# EasyEDA Pro project RK3566_handy_V1.0.epro, schematic RK3566_2, sheets 21 to 23 of 25

## Sheets
21 Power_Extern: Create Date: 2026-10-03; Page Name: Power_Extern; Update Date: 2026-10-03
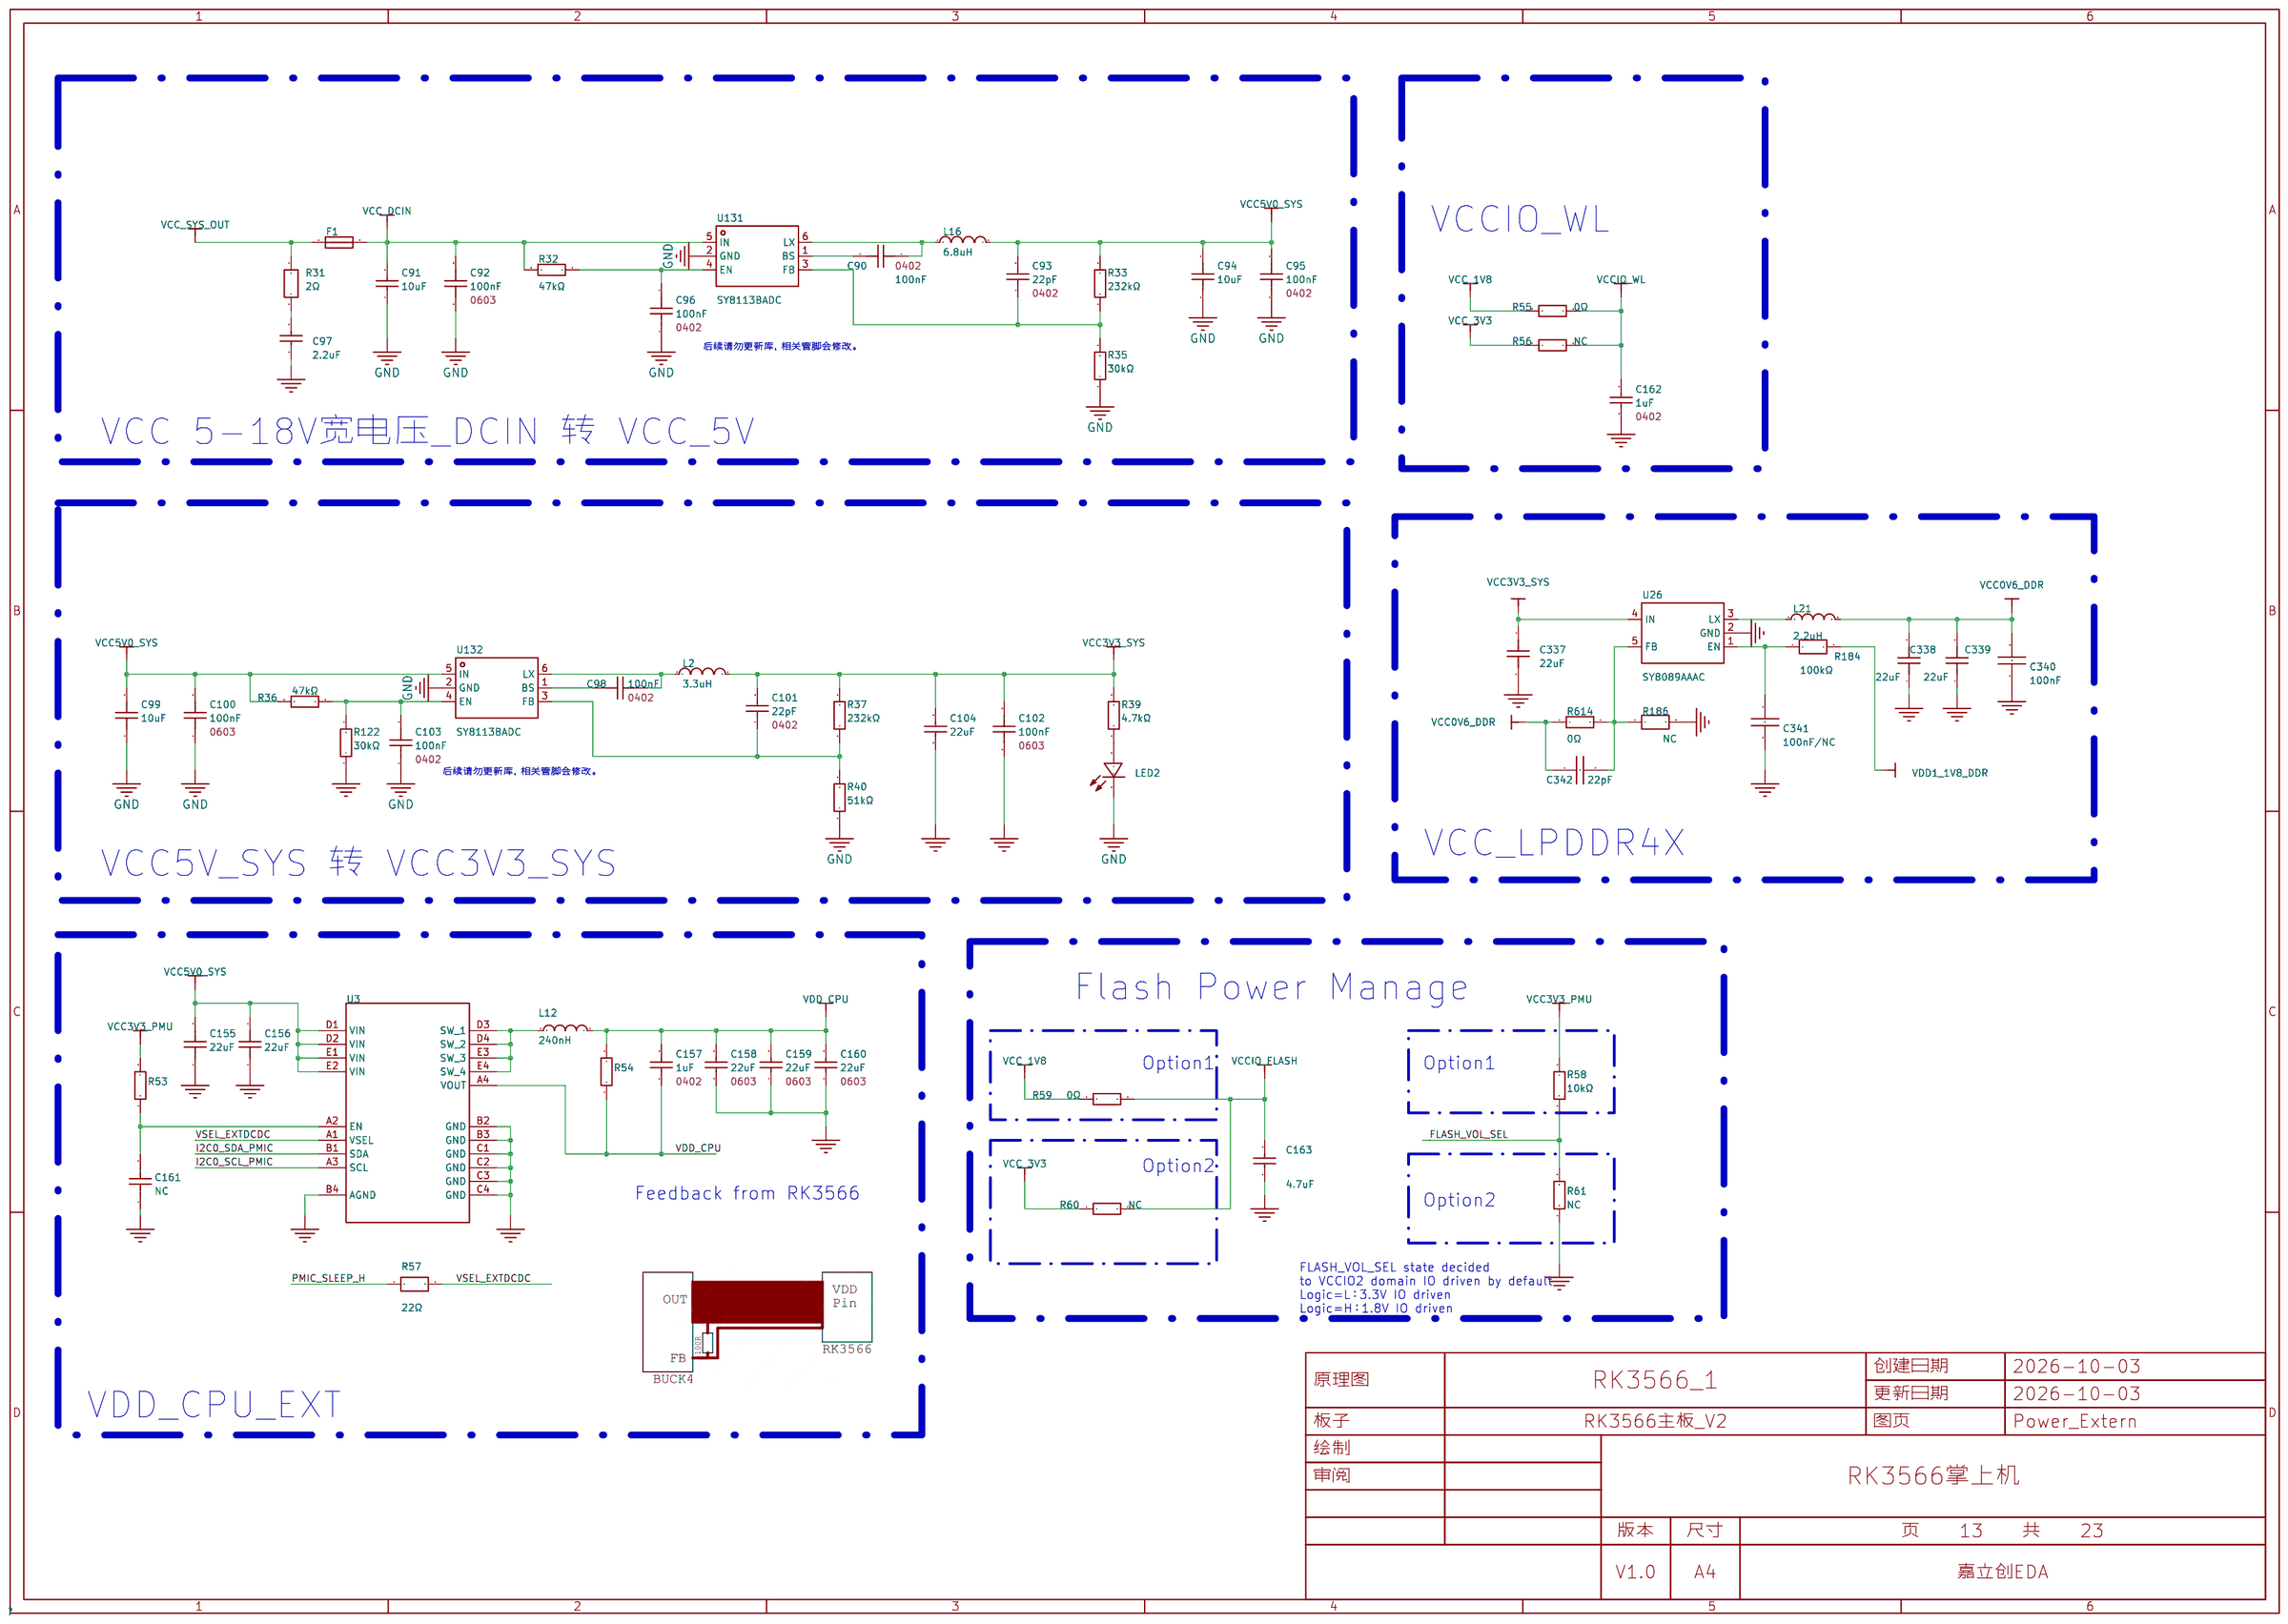
[diagram p20: Power_Extern]
22 Power_RK809-5_PMIC: Create Date: 2026-10-03; Page Name: Power_RK809-5_PMIC; Update Date: 2026-10-03
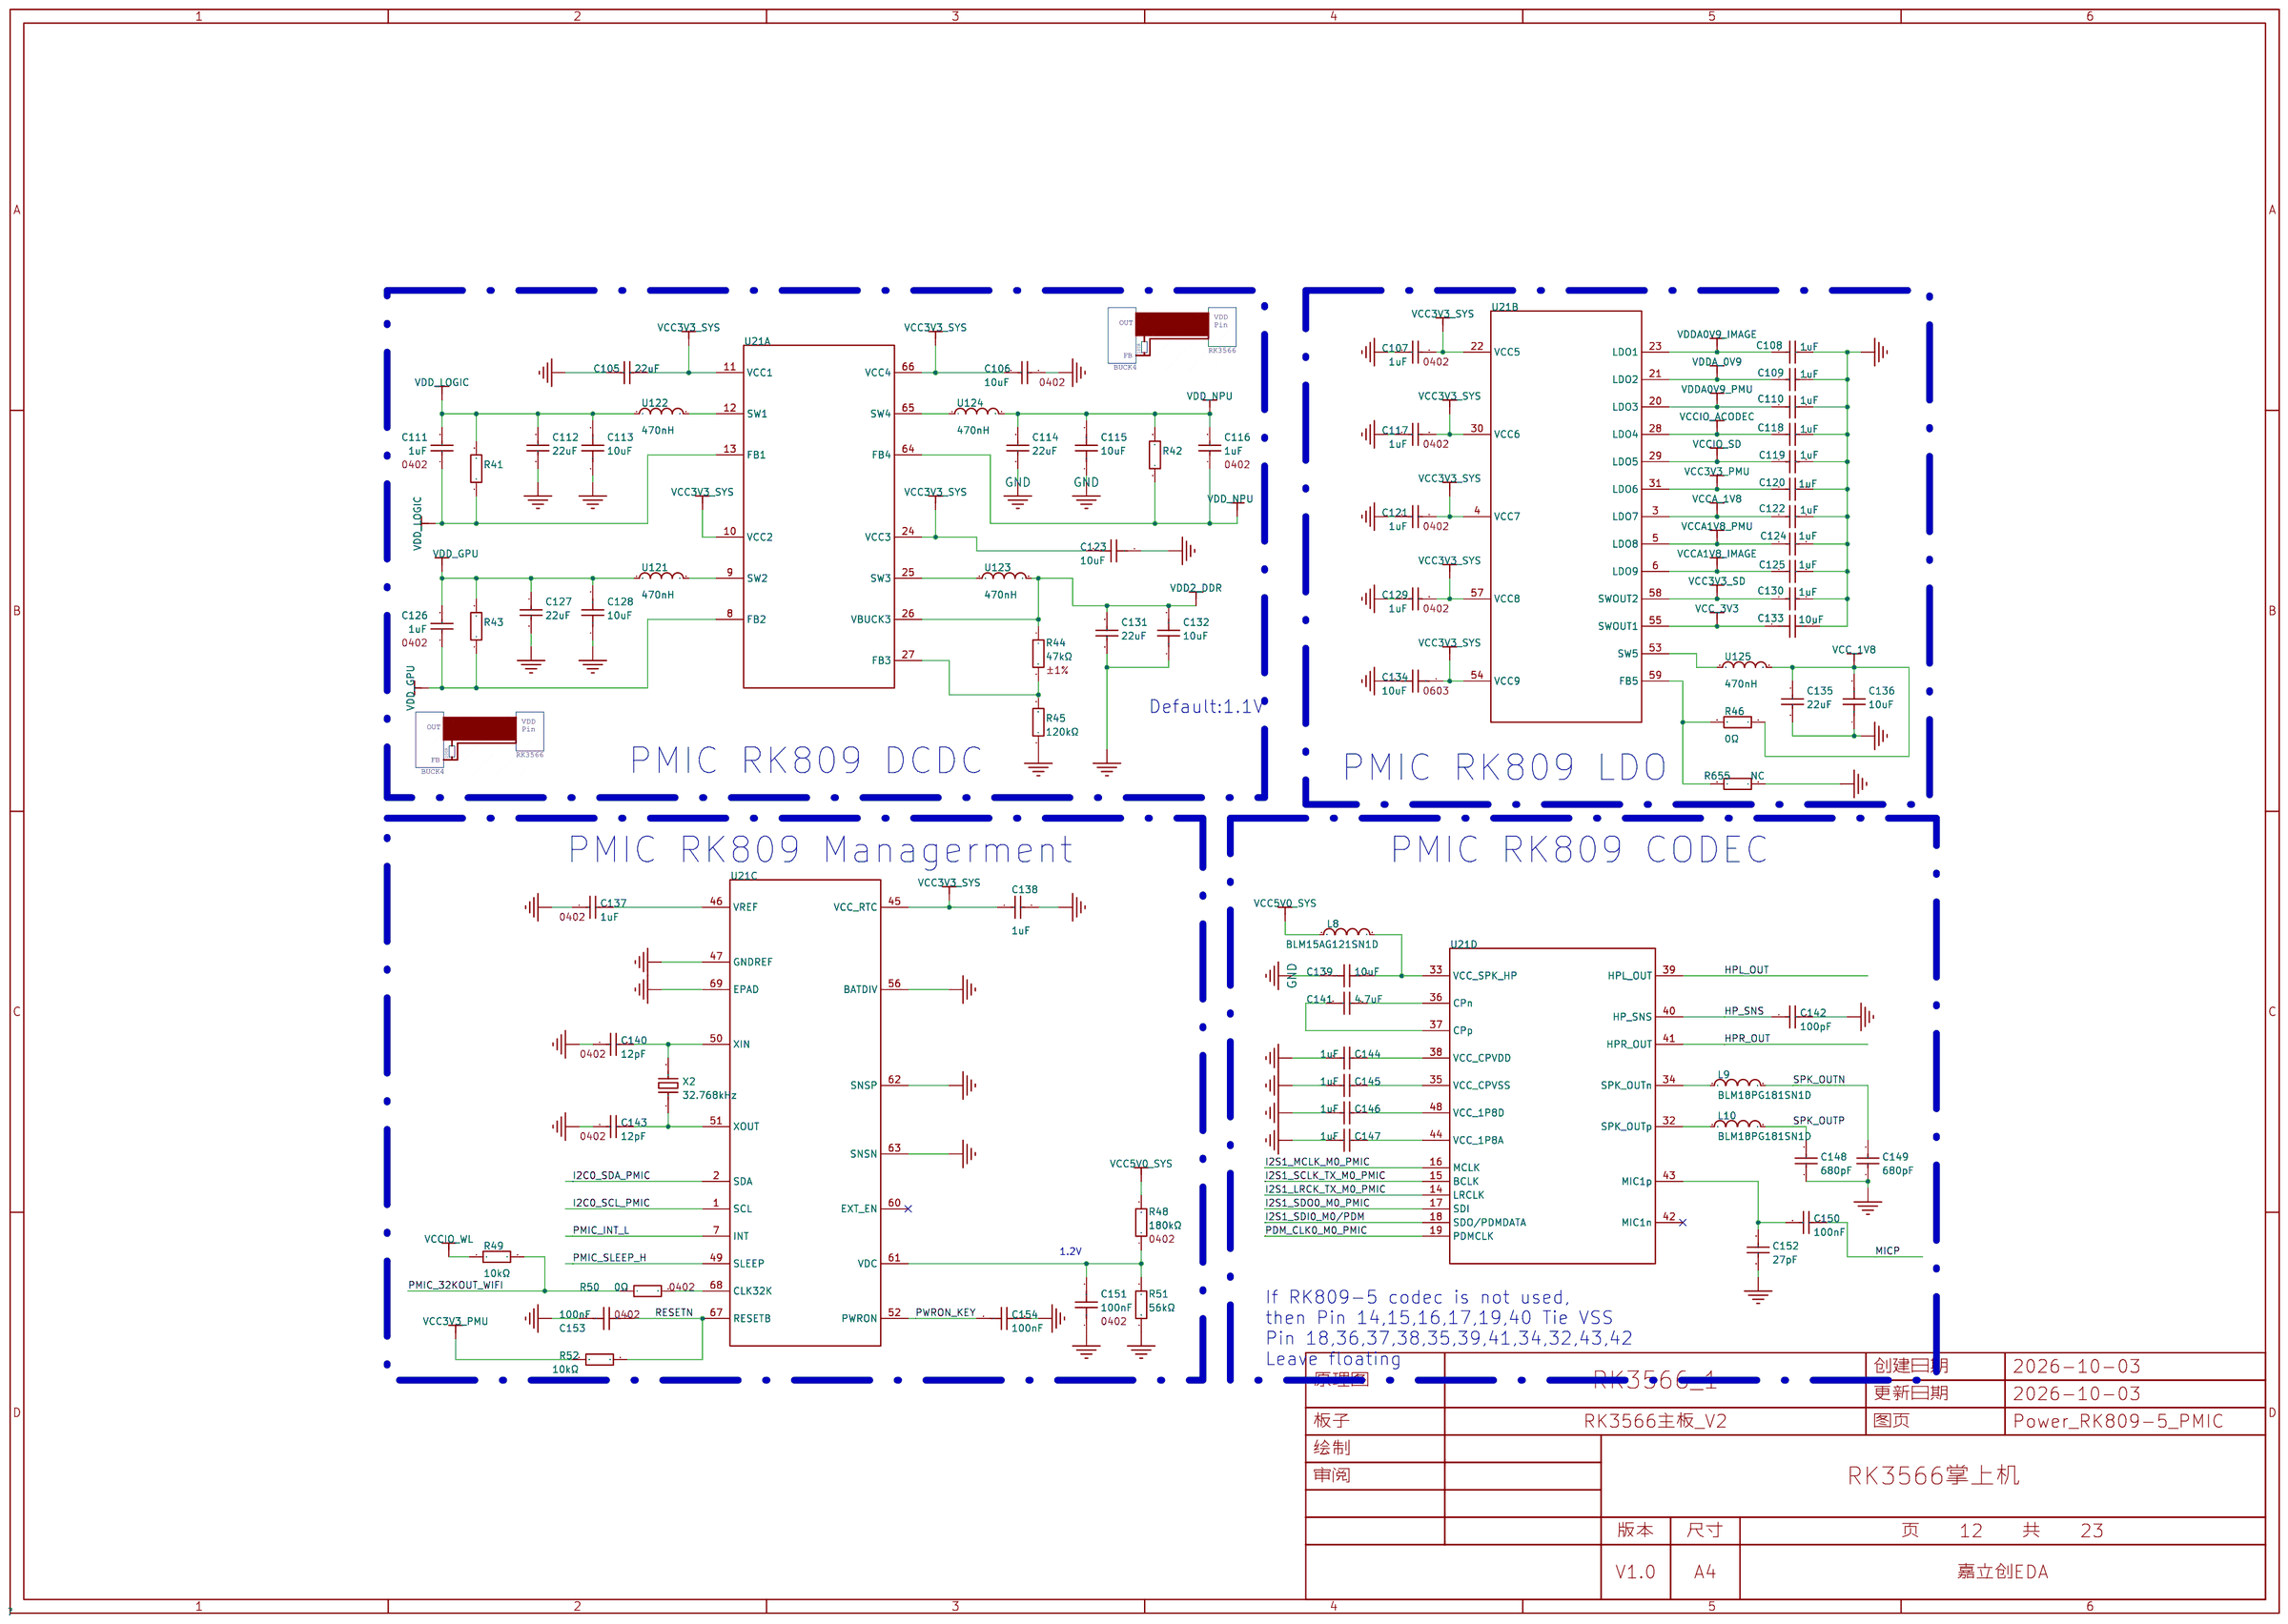
[diagram p21: Power_RK809-5_PMIC]
23 WIFI: Create Date: 2026-10-03; Page Name: WIFI; Update Date: 2026-10-03
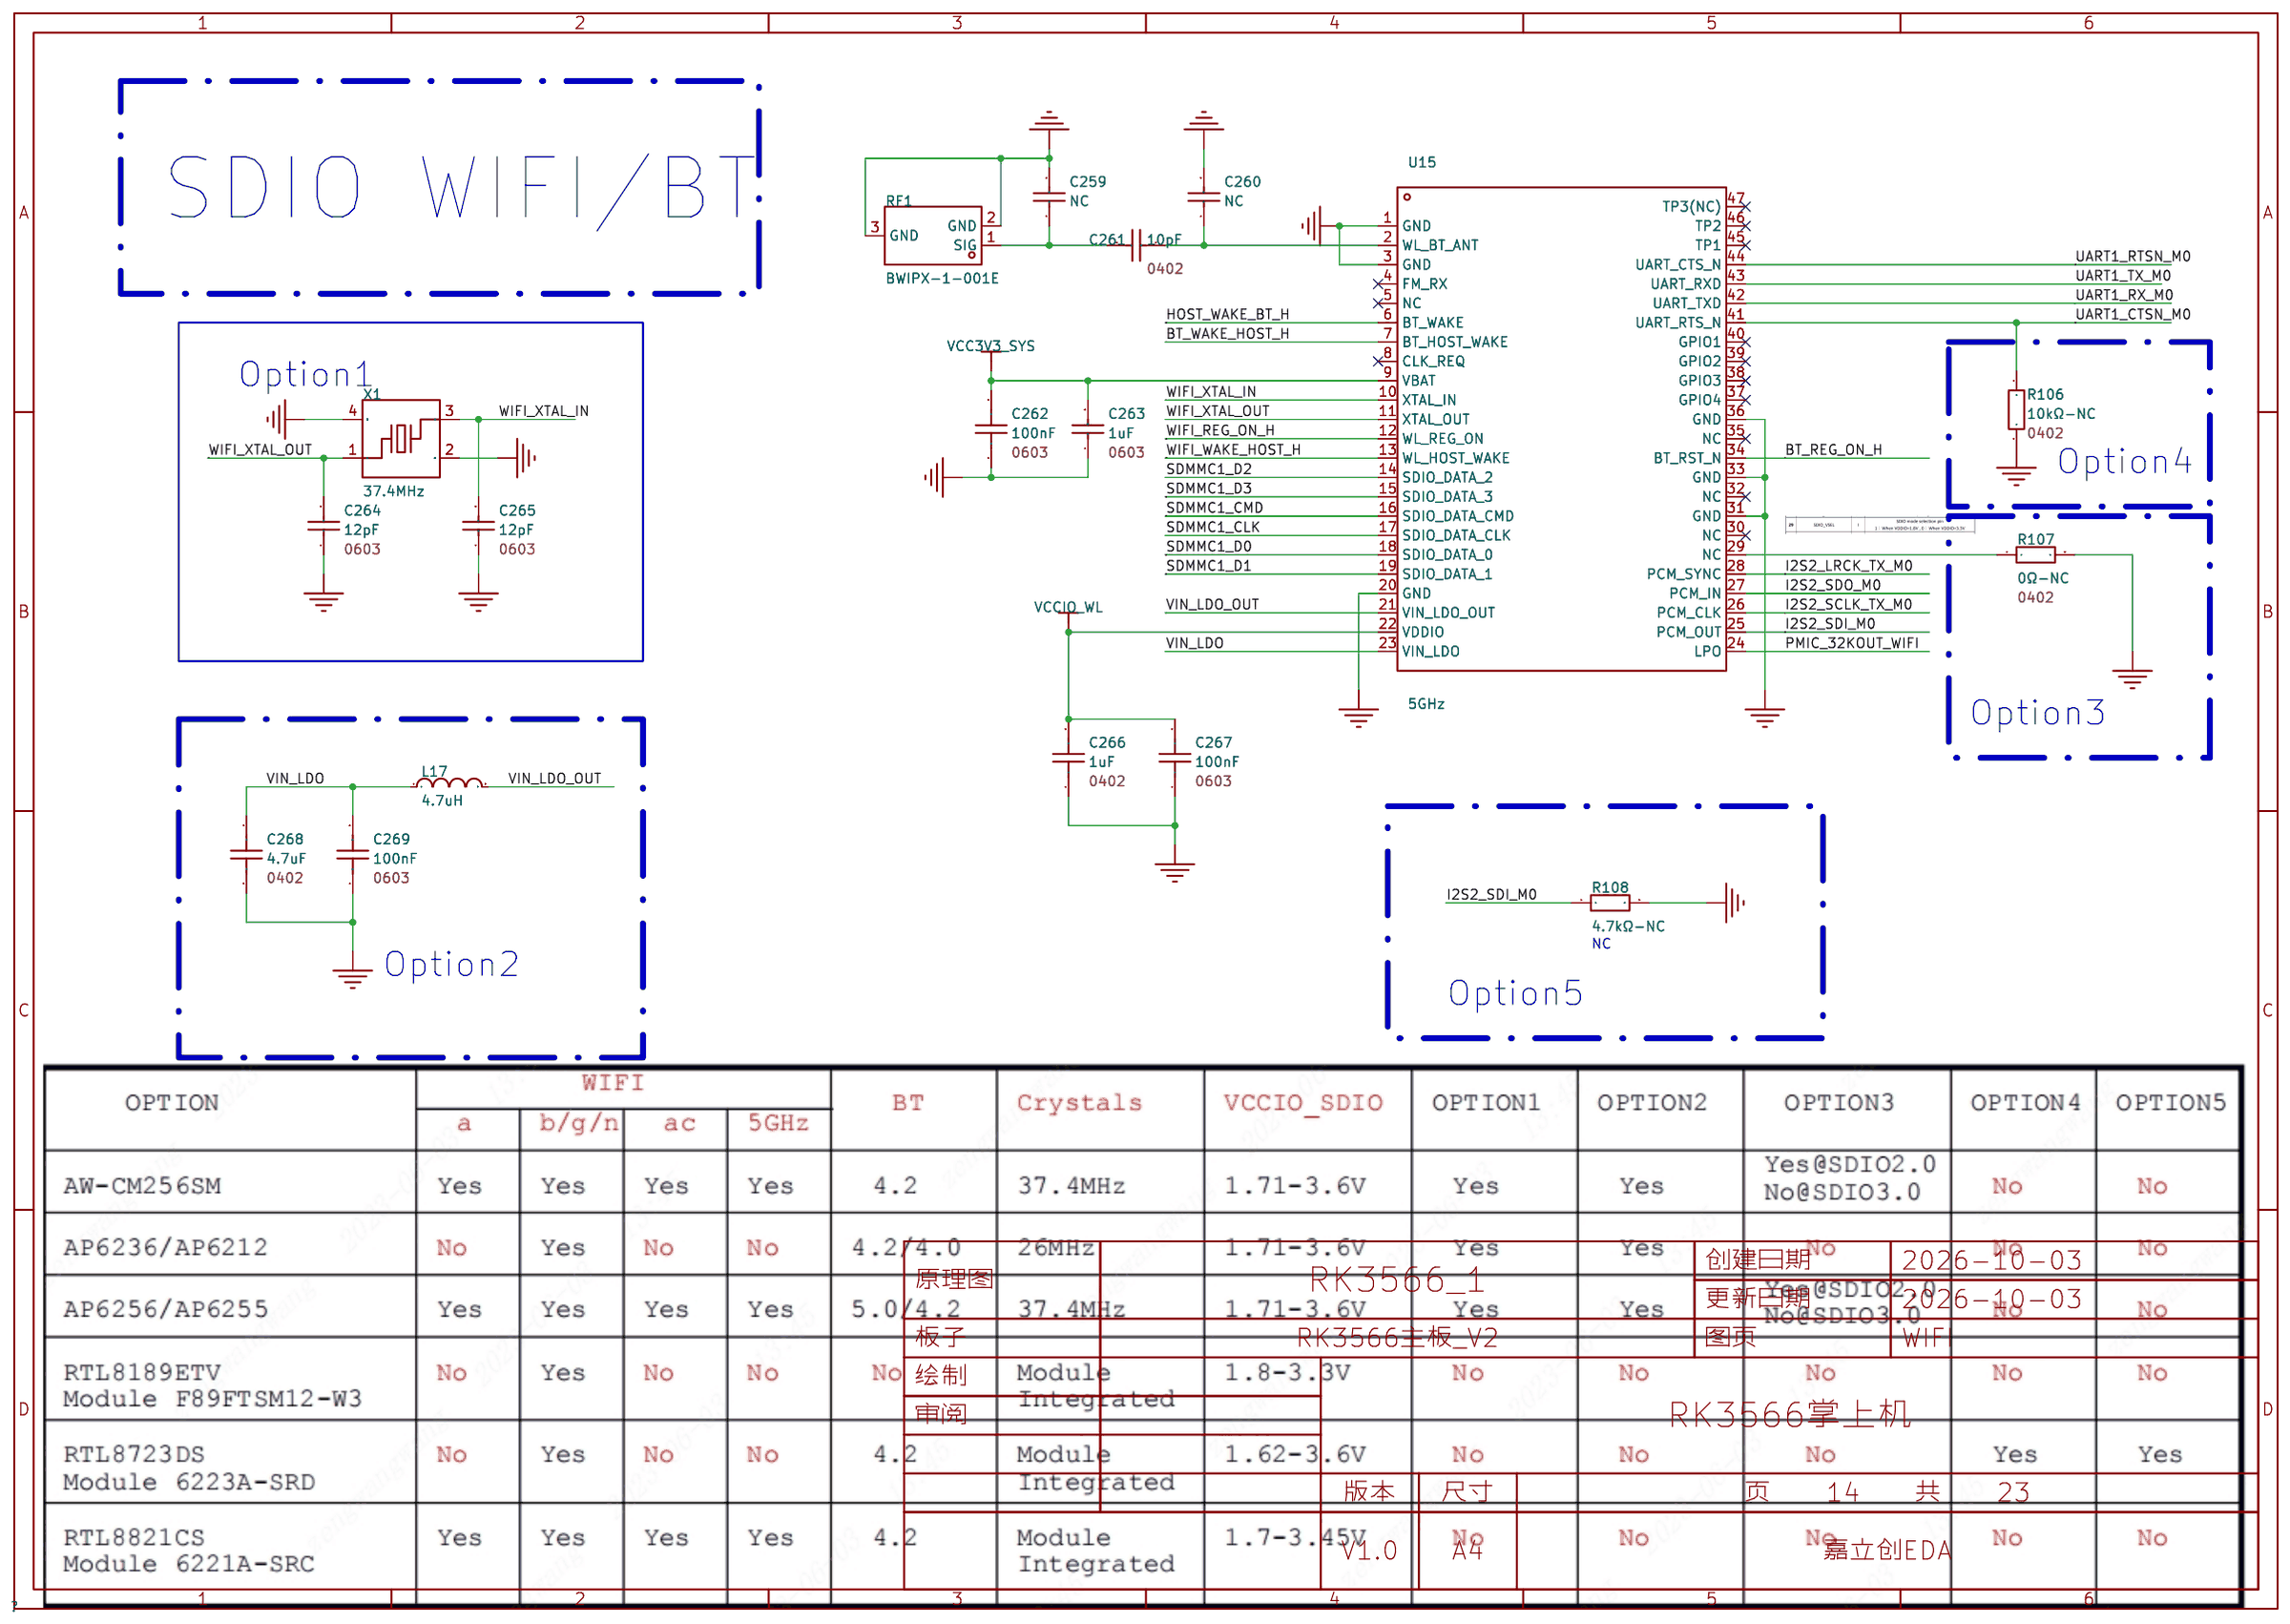
[diagram p22: WIFI]

## Parts
sheet Power_Extern
C90  100nF  [LL_0402]
C91  10uF  [C0805]
C92  100nF  [LL_0603]
C93  22pF  [LL_0402]
C94  10uF  [LL_0603]
C95  100nF  [LL_0402]
C96  100nF  [LL_0402]
C97  2.2uF  [C0805]
C98  100nF  [LL_0402]
C99  10uF  [LL_0603]
C100  100nF  [LL_0603]
C101  22pF  [LL_0402]
C102  100nF  [LL_0603]
C103  100nF  [LL_0402]
C104  22uF  [LL_0603]
C155  22uF  [LL_0603]
C156  22uF  [LL_0603]
C157  1uF  [LL_0402]
C158  22uF  [LL_0603]
C159  22uF  [LL_0603]
C160  22uF  [LL_0603]
C161  NC  [LL_0402]
C162  1uF  [LL_0402]
C163  4.7uF  [LL_0402]
C337  22uF  [LL_0603]
C338  22uF  [LL_0603]
C339  22uF  [LL_0603]
C340  100nF  [LL_0402]
C341  100nF/NC  [LL_0402]
C342  22pF  [LL_0402]
F1  BSMD0805L-200  [F0805]
L2  3.3uH  [IND-SMD_L4.4-W4.2]
L12  240nH  [IND-SMD_L2.5-W2.0_WPN252012H]
L16  6.8uH  [IND-SMD_L4.4-W4.2]
L21  2.2uH  [IND-SMD_L2.5-W2.0_MHCHL2520]
LED2  KT-0603B  [LED0603-RD]
R31  2Ω  [R0805]
R32  47kΩ  [LL_0402]
R33  232kΩ  [LL_0402]
R35  30kΩ  [LL_0402]
R36  47kΩ  [LL_0402]
R37  232kΩ  [LL_0402]
R39  4.7kΩ  [LL_0402]
R40  51kΩ  [LL_0402]
R53  0402WGF5102TCE  [LL_0402]
R54  0402WGF1000TCE  [LL_0402]
R55  0Ω  [LL_0402]
R56  NC  [LL_0402]  (no BOM)
R57  22Ω  [LL_0402]
R58  10kΩ  [LL_0402]
R59  0Ω  [LL_0402]
R60  NC  [LL_0402]
R61  NC  [LL_0402]
R122  30kΩ  [LL_0402]
R184  100kΩ  [LL_0402]
R186  NC  [LL_0402]
R614  0Ω  [LL_0402]
U3  -  [TCS4525]
U26  SY8089AAAC  [SOT-23-5_L3.0-W1.7-P0.95-LS2.8-BR]
U131  SY8113BADC  [TSOT-23-6_L2.9-W1.6-P0.95-LS2.8-BR]
U132  SY8113BADC  [TSOT-23-6_L2.9-W1.6-P0.95-LS2.8-BR]
sheet Power_RK809-5_PMIC
C105  22uF  [LL_0603]
C106  10uF  [LL_0402]
C107  1uF  [LL_0402]
C108  1uF  [LL_0402]
C109  1uF  [LL_0402]
C110  1uF  [LL_0402]
C111  1uF  [LL_0402]
C112  22uF  [LL_0603]
C113  10uF  [LL_0603]
C114  22uF  [LL_0603]
C115  10uF  [LL_0603]
C116  1uF  [LL_0402]
C117  1uF  [LL_0402]
C118  1uF  [LL_0402]
C119  1uF  [LL_0402]
C120  1uF  [LL_0402]
C121  1uF  [LL_0402]
C122  1uF  [LL_0402]
C123  10uF  [LL_0603]
C124  1uF  [LL_0402]
C125  1uF  [LL_0402]
C126  1uF  [LL_0402]
C127  22uF  [LL_0603]
C128  10uF  [LL_0603]
C129  1uF  [LL_0402]
C130  1uF  [LL_0402]
C131  22uF  [LL_0603]
C132  10uF  [LL_0603]
C133  10uF  [LL_0603]
C134  10uF  [LL_0603]
C135  22uF  [LL_0603]
C136  10uF  [LL_0603]
C137  1uF  [LL_0402]
C138  1uF  [LL_0402]
C139  10uF  [LL_0402]
C140  12pF  [LL_0402]
C141  4.7uF  [LL_0402]
C142  100pF  [LL_0402]
C143  12pF  [LL_0402]
C144  1uF  [LL_0402]
C145  1uF  [LL_0402]
C146  1uF  [LL_0402]
C147  1uF  [LL_0402]
C148  680pF  [LL_0402]
C149  680pF  [LL_0402]
C150  100nF  [LL_0402]
C151  100nF  [LL_0402]
C152  27pF  [LL_0402]
C153  100nF  [LL_0402]
C154  100nF  [LL_0402]
L8  BLM15AG121SN1D  [L0402]
L9  BLM18PG181SN1D  [L0603]
L10  BLM18PG181SN1D  [L0603]
R41  0402WGF1000TCE  [LL_0402]
R42  0402WGF1000TCE  [LL_0402]
R43  0402WGF1000TCE  [LL_0402]
R44  47kΩ  [LL_0402]
R45  120kΩ  [LL_0402]
R46  0Ω  [LL_0402]
R48  180kΩ  [LL_0402]
R49  10kΩ  [LL_0402]
R50  0Ω  [LL_0402]
R51  56kΩ  [LL_0402]
R52  10kΩ  [LL_0402]
R655  NC  [LL_0402]  (no BOM)
U21  -  [RK809-5]  (sections 1,2,3,4)
U121  470nH  [IND-SMD_L2.5-W2.0]
U122  470nH  [IND-SMD_L2.5-W2.0]
U123  470nH  [IND-SMD_L2.5-W2.0]
U124  470nH  [IND-SMD_L2.5-W2.0]
U125  470nH  [IND-SMD_L2.5-W2.0]
X2  32.768kHz  [CRYSTAL-SMD_L3.2-W1.5-1]
sheet WIFI
C259  NC  [LL_0402]
C260  NC  [LL_0402]
C261  10pF  [LL_0402]
C262  100nF  [LL_0603]
C263  1uF  [LL_0603]
C264  12pF  [LL_0603]
C265  12pF  [LL_0603]
C266  1uF  [LL_0402]
C267  100nF  [LL_0603]
C268  4.7uF  [LL_0402]
C269  100nF  [LL_0603]
L17  4.7uH  [L1008]
R106  10kΩ-NC  [LL_0402]  (no BOM)
R107  0Ω-NC  [LL_0402]  (no BOM)
R108  4.7kΩ-NC  [LL_0402]  (no BOM)
RF1  BWIPX-1-001E  [IPEX-SMD_BWIPX-1-001E]
U15  5GHz  [QFN-44_L12.0-W12.0-P0.90-TL_AP6256]
X1  37.4MHz  [CRYSTAL-SMD_4P-L2.0-W1.6-BL-2]

## Library data of the parts
C90 C95 C96 C98 C103 C151 C153 C154 = CL05B104KB54PNC: 容值:100nF;精度:±10%;额定电压:50V;温度系数:X7R;; LCSC Part Name: 100nF ±10% 50V; Supplier Part: C307331; Manufacturer: SAMSUNG(三星); Supplier Footprint: 0402; JLCPCB Part Class: 基础库; Datasheet: https://item.szlcsc.com/datasheet/CL05B104KB54PNC/291005.html; Supplier: LCSC; Tolerance: ±10%; Voltage Rating: 50V; Temperature Coefficient: X7R; Voltage Rated: 50V
C91 = CL21A106KAYNNNE_C15850: 容值:10uF;精度:±10%;额定电压:25V;材质(温度系数):X5R;; LCSC Part Name: 10uF ±10% 25V; Supplier Part: C15850; Manufacturer: SAMSUNG(三星); Manufacturer Part: CL21A106KAYNNNE; Supplier Footprint: 0805; JLCPCB Part Class: Basic Part; Datasheet: https://atta.szlcsc.com/upload/public/pdf/source/20160103/1457707679302.pdf; Supplier: LCSC; Tolerance: ±10%; Voltage Rated: 25V; Temperature Coefficient: X5R
C92 C100 C102 C262 C267 C269 = CC0603KRX7R9BB104: 容值:100nF;精度:±10%;额定电压:50V;材质(温度系数):X7R;; LCSC Part Name: 100nF ±10% 50V; Supplier Part: C14663; Manufacturer: YAGEO(国巨); Supplier Footprint: 0603; JLCPCB Part Class: Basic Part; Datasheet: https://atta.szlcsc.com/upload/public/pdf/source/20170116/1484561234239.pdf; Supplier: LCSC; Tolerance: ±10%; Voltage Rated: 50V; Temperature Coefficient: X7R
C93 C101 C342 = 0402CG220J500NT: 容值:22pF;精度:±5%;额定电压:50V;材质(温度系数):C0G;; LCSC Part Name: 22pF ±5% 50V; Supplier Part: C1555; Manufacturer: FH(风华); Supplier Footprint: 0402; JLCPCB Part Class: Basic Part; Datasheet: https://atta.szlcsc.com/upload/public/pdf/source/20200305/C486355_26A10D38EF8C2A5C37091D0039909270.pdf; Supplier: LCSC; Tolerance: ±5%; Voltage Rated: 50V; Temperature Coefficient: C0G
C94 C99 C113 C115 C123 C128 C132-C134 C136 = CL10A106KP8NNNC: 容值:10uF;精度:±10%;额定电压:10V;材质(温度系数):X5R;; LCSC Part Name: 10uF ±10% 10V; Supplier Part: C19702; Manufacturer: SAMSUNG(三星); Supplier Footprint: 0603; JLCPCB Part Class: Basic Part; Datasheet: https://atta.szlcsc.com/upload/public/pdf/source/20160103/1457707703378.pdf; Supplier: LCSC; Tolerance: ±10%; Voltage Rated: 10V; Temperature Coefficient: X5R
C97 = CL21B225KAFNNNE: 容值:2.2uF;精度:±10%;额定电压:25V;材质(温度系数):X7R;; LCSC Part Name: 2.2uF ±10% 25V; Supplier Part: C19110; Manufacturer: SAMSUNG(三星); Supplier Footprint: 0805; JLCPCB Part Class: 扩展库; Datasheet: https://atta.szlcsc.com/upload/public/pdf/source/20160103/1457707702018.pdf; Supplier: LCSC; Tolerance: ±10%; Voltage Rated: 25V; Temperature Coefficient: X7R
C104 C105 C112 C114 C127 C131 C135 C155 C156 C158-C160 C338 C339 = CL10A226MQ8NRNC: 容值:22uF;精度:±20%;额定电压:6.3V;材质(温度系数):X5R;; LCSC Part Name: 22uF ±20% 6.3V; Supplier Part: C59461; Manufacturer: SAMSUNG(三星); Supplier Footprint: 0603; JLCPCB Part Class: Basic Part; Datasheet: https://atta.szlcsc.com/upload/public/pdf/source/20160103/1457707740762.pdf; Supplier: LCSC; Tolerance: ±20%; Voltage Rated: 6.3V; Temperature Coefficient: X5R
C107-C111 C116-C122 C124-C126 C129 C130 C137 C138 C144-C147 C157 C162 = CL05A105KP5NNNC: 容值:1uF;精度:±10%;额定电压:10V;材质(温度系数):X5R;; LCSC Part Name: 1uF ±10% 10V; Supplier Part: C14445; Manufacturer: SAMSUNG(三星); Supplier Footprint: 0402; JLCPCB Part Class: 扩展库; Datasheet: https://atta.szlcsc.com/upload/public/pdf/source/20160103/1457707670698.pdf; Supplier: LCSC; Tolerance: ±10%; Voltage Rated: 10V; Temperature Coefficient: X5R
C161 = CL05B104KB54PNC: 容值:100nF;精度:±10%;额定电压:50V;温度系数:X7R;; LCSC Part Name: 100nF ±10% 50V; Manufacturer: SAMSUNG(三星); Supplier Footprint: 0402; JLCPCB Part Class: 基础库; Datasheet: https://item.szlcsc.com/datasheet/CL05B104KB54PNC/291005.html; Supplier: LCSC; Tolerance: ±10%; Voltage Rating: 50V; Temperature Coefficient: X7R; Voltage Rated: 50V
C163 = CL05A475KP5NRNC: 容值:4.7uF;精度:±10%;额定电压:10V;材质(温度系数):X5R;; LCSC Part Name: 4.7uF ±10% 10V; Supplier Part: C368809; Manufacturer: SAMSUNG(三星); Supplier Footprint: 0402; JLCPCB Part Class: Extended Part; Datasheet: https://atta.szlcsc.com/upload/public/pdf/source/20190214/C368809_F5BC89A17870A6A4D09EEE17ED063906.pdf; Supplier: LCSC; Tolerance: ±10%; Voltage Rated: 10V; Temperature Coefficient: X5R
C337 = CL10A226MO7JZNC: 容值:22uF;精度:±20%;额定电压:16V;温度系数:X5R;; LCSC Part Name: 22uF ±20% 16V; Supplier Part: C2762594; Manufacturer: SAMSUNG(三星); Supplier Footprint: 0603; JLCPCB Part Class: 扩展库; Datasheet: https://item.szlcsc.com/datasheet/CL10A226MO7JZNC/2889856.html; Supplier: LCSC; Tolerance: ±20%; Voltage Rating: 16V; Temperature Coefficient: X5R
C340 C341 = FN15X104K160PNG: 容值:100nF;精度:±10%;额定电压:16V;温度系数:X7R;; LCSC Part Name: 100nF ±10% 16V; Supplier Part: C328914; Manufacturer: PSA(信昌电陶); Supplier Footprint: 0402; JLCPCB Part Class: Extended Part; Datasheet: https://atta.szlcsc.com/upload/public/pdf/source/20190530/C394159_0C27B7C3BD562F6422EEB4EC92C9B30A.pdf; Supplier: LCSC; Tolerance: ±10%; Voltage Rating: 16V; Temperature Coefficient: X7R
F1 = BSMD0805L-200: 最大电压:6V;最大电流:50A;保持电流:2A;跳闸电流:4A;; LCSC Part Name: 6V 2A 0805自恢复 5秒内动作; Supplier Part: C2757931; Manufacturer: BHFUSE(佰宏); Supplier Footprint: 0805; Datasheet: https://atta.szlcsc.com/upload/public/pdf/source/20220302/84A1D93E6CA84F7719C829CBF191FAF8.pdf; Supplier: LCSC; Operating Voltage (Max): 6V; Current Rating (Max): 50A; Hold Current: 2A; Trip Current: 4A; Power Dissipation: 1W; Resistance - Initial (Ri) (Min): 4mΩ; Resistance - Post Trip (R1) (Max): 45mΩ; Maximum Time to Trip: 5s; Operating Temperature: -40℃~+85℃
L2 = MWSA0402S-3R3MT: 额定电流:3.3A;精度:±20%;电感值:3.3uH;直流电阻(DCR):87mΩ;; LCSC Part Name: 3.3uH ±20%; Supplier Part: C408336; Manufacturer: Sunlord(顺络); Supplier Footprint: SMD; JLCPCB Part Class: Extended Part; Datasheet: https://atta.szlcsc.com/upload/public/pdf/source/20190729/C408336_17B5BB1DF2845DE8F323BD9CE9EEFEBA.pdf; Supplier: LCSC; Height: 2mm; Rated Current: 3.3A; Width: 4.4mm; Tolerance: ±20%; DC Resistance (DCR): 87mΩ; Length: 4.2mm
L12 = WPN252012HR24MT: 电感值:240nH;精度:±20%;额定电流:4.05A;饱和电流(Isat):-;直流电阻(DCR):19mΩ;; LCSC Part Name: 240nH ±20% 4.05A 19mΩ; Supplier Part: C305274; Manufacturer: Sunlord(顺络); Supplier Footprint: SMD; JLCPCB Part Class: Extended Part; Datasheet: https://atta.szlcsc.com/upload/public/pdf/source/20210916/5D33DED32780FEB7D0AA8BED8FC93477.pdf; Supplier: LCSC; Tolerance: ±20%; Rated Current: 4.05A; DC Resistance (DCR): 19mΩ
L16 = FXL0420-6R8-M: 电感值:6.8uH;精度:±20%;额定电流:2.4A;饱和电流(Isat):2.5A;; LCSC Part Name: 6.8uH ±20% 2.5A; Supplier Part: C177241; Manufacturer: cjiang(长江微电); Supplier Footprint: SMD,4.2x4.4mm; JLCPCB Part Class: 扩展库; Datasheet: https://atta.szlcsc.com/upload/public/pdf/source/20190322/C177241_926E0DC8333CBC0DC90F3B0802D0087D.pdf; Supplier: LCSC; Tolerance: ±20%; Rated Current: 2.4A; Saturation Current (Isat): 2.5A; DC Resistance (DCR): 160mΩ
L21 = FTC252012S2R2MBCA: 电感值:2.2uH;精度:±20%;额定电流:3A;饱和电流(Isat):3.8A;类型:一体成型电感;; LCSC Part Name: 2.2uH ±20% 3.8A; Supplier Part: C5832372; Manufacturer: cjiang(长江微电); Supplier Footprint: 1008; JLCPCB Part Class: 扩展库; Datasheet: https://atta.szlcsc.com/upload/public/pdf/source/20230602/8FFEDA9C0247A92A0D4B67554BFE4091.pdf; Supplier: LCSC; Tolerance: ±20%; Rated Current: 3A; Saturation Current (Isat): 3.8A; DC Resistance (DCR): 55mΩ; Type: 一体成型电感
LED2 = KT-0603B: 灯头类型:1.6mmx0.8mm方形灯头;发光颜色:蓝色;正向压降(Vf):3.1V;功率:100mW;正向电流:5mA;波长:460nm~475nm;二极管配置:独立二极管;透镜颜色:无色透明透镜;色温:-;发光强度:175mcd;发光角度:120°;载带方式:-;工作温度:-40℃~+85℃;; LCSC Part Name: 0603 蓝灯 高亮; Supplier Part: C2288; Manufacturer: KENTO; Supplier Footprint: 0603; JLCPCB Part Class: Extended Part; Datasheet: https://item.szlcsc.com/datasheet/KT-0603B/2661.html; Supplier: LCSC; Lamp Holder Type: 1.6mmx0.8mm方形灯头; Illumination Color: 蓝色; Voltage - Forward(Vf): 3.1V; Power(Watts): 100mW; Forward Current: 5mA; Wavelength - Dominant: 460nm~475nm; Peak Wavelength: 469nm; Diode Configuration: 独立二极管; Lens Color: 无色透明透镜; Luminous Intensity: 175mcd; Viewing Angle: 120°; Operating Temperature: -40℃~+85℃
R31 = 0805W8F200KT5E: 电阻类型:厚膜电阻;阻值:2Ω;精度:±1%;功率:125mW;; LCSC Part Name: 2Ω ±1% 125mW; Supplier Part: C17606; Manufacturer: UNI-ROYAL(厚声); Supplier Footprint: 0805; JLCPCB Part Class: Basic Part; Datasheet: https://atta.szlcsc.com/upload/public/pdf/source/20200306/C422600_1E6D84923E4A46A82E41ADD87F860B5C.pdf; Supplier: LCSC; Type: 厚膜电阻; Tolerance: ±1%; Power(Watts): 125mW; Temperature Coefficient: ±400ppm/℃; Overload Voltage (Max): 150V; Operating Temperature Range: -55℃~+155℃
R32 R36 = 0402WGF4702TCE: 电阻类型:厚膜电阻;阻值:47kΩ;精度:±1%;功率:62.5mW;; LCSC Part Name: 47kΩ ±1% 62.5mW; Supplier Part: C25792; Manufacturer: UNI-ROYAL(厚声); Supplier Footprint: 0402; JLCPCB Part Class: Basic Part; Datasheet: https://atta.szlcsc.com/upload/public/pdf/source/20200306/C422600_1E6D84923E4A46A82E41ADD87F860B5C.pdf; Supplier: LCSC; Type: 厚膜电阻; Tolerance: ±1%; Power(Watts): 62.5mW; Temperature Coefficient: ±100ppm/℃; Overload Voltage (Max): 50V; Operating Temperature Range: -55℃~+155℃
R33 R37 = RC0402FR-07232KL: 电阻类型:厚膜电阻;阻值:232kΩ;精度:±1%;功率:62.5mW;; LCSC Part Name: 232kΩ ±1% 62.5mW; Supplier Part: C309542; Manufacturer: YAGEO(国巨); Supplier Footprint: 0402; JLCPCB Part Class: Extended Part; Datasheet: https://atta.szlcsc.com/upload/public/pdf/source/20181009/C309542_CA3F4488430805647C87B9489F02B718.pdf; Supplier: LCSC; Type: 厚膜电阻; Tolerance: ±1%; Power(Watts): 62.5mW; Temperature Coefficient: ±100ppm/℃; Overload Voltage (Max): 50V; Operating Temperature Range: -55℃~+155℃
R35 = RC0402FR-0730KL: 电阻类型:厚膜电阻;阻值:30kΩ;精度:±1%;功率:62.5mW;温度系数:±100ppm/℃;最大工作电压:50V;工作温度范围:-55℃~+155℃;; LCSC Part Name: 30kΩ ±1% 62.5mW; Supplier Part: C138008; Manufacturer: YAGEO(国巨); Supplier Footprint: 0402; JLCPCB Part Class: Extended Part; Datasheet: https://atta.szlcsc.com/upload/public/pdf/source/20171107/C138008_15100516356731096935.pdf; Supplier: LCSC; Type: 厚膜电阻; Tolerance: ±1%; Power(Watts): 62.5mW; Temperature Coefficient: ±100ppm/℃; Overload Voltage (Max): 50V; Operating Temperature Range: -55℃~+155℃
R39 R108 = 0402WGF4701TCE: 电阻类型:厚膜电阻;阻值:4.7kΩ;精度:±1%;功率:62.5mW;; LCSC Part Name: 4.7kΩ ±1% 62.5mW; Supplier Part: C25900; Manufacturer: UNI-ROYAL(厚声); Supplier Footprint: 0402; JLCPCB Part Class: 基础库; Datasheet: https://atta.szlcsc.com/upload/public/pdf/source/20200306/C422600_1E6D84923E4A46A82E41ADD87F860B5C.pdf; Supplier: LCSC; Type: 厚膜电阻; Tolerance: ±1%; Power(Watts): 62.5mW; Temperature Coefficient: ±100ppm/℃; Overload Voltage (Max): 50V; Operating Temperature Range: -55℃~+155℃
R40 = 0402WGF5102TCE: 电阻类型:厚膜电阻;阻值:51kΩ;精度:±1%;功率:62.5mW;; LCSC Part Name: 51kΩ ±1% 62.5mW; Supplier Part: C25794; Manufacturer: UNI-ROYAL(厚声); Supplier Footprint: 0402; JLCPCB Part Class: Basic Part; Datasheet: https://atta.szlcsc.com/upload/public/pdf/source/20200306/C422600_1E6D84923E4A46A82E41ADD87F860B5C.pdf; Supplier: LCSC; Type: 厚膜电阻; Tolerance: ±1%; Power(Watts): 62.5mW; Temperature Coefficient: ±100ppm/℃; Overload Voltage (Max): 50V; Operating Temperature Range: -55℃~+155℃
R53 = 0402WGF5102TCE: LCSC Part Name: 51KΩ(5102) ±1% 编带; Supplier Part: C25794; Manufacturer: UNI-ROYAL(厚声); Supplier Footprint: 0402; JLCPCB Part Class: Basic Part; Datasheet: https://atta.szlcsc.com/upload/public/pdf/source/20170920/C25794_1505901546513983367.pdf; Supplier: LCSC
R41-R43 R54 = 0402WGF1000TCE: Supplier: LCSC; Supplier Part: C25076; Supplier Footprint: 0402; JLCPCB Part Class: Basic Part; LCSC Part Name: 100Ω(1000) ±1% 编带; Datasheet: https://atta.szlcsc.com/upload/public/pdf/source/20170920/C25076_1505901197574982707.pdf; Manufacturer: UNI-ROYAL(厚声)
R46 R50 R55 R59 R614 R655 = ERJ2GE0R00X: 电阻类型:-;阻值:0Ω;功率:100mW;温度系数:-100ppm/℃~+600ppm/℃;最大工作电压:-;工作温度范围:-55℃~+155℃;; LCSC Part Name: 0Ω 100mW; Supplier Part: C242160; Manufacturer: PANASONIC(松下); Supplier Footprint: 0402; JLCPCB Part Class: 扩展库; Datasheet: https://atta.szlcsc.com/upload/public/pdf/source/20181106/C242160_CA6E41971DE5A1DCD79442F3CF334CD6.pdf; Supplier: LCSC; Power(Watts): 100mW; Temperature Coefficient: -100ppm/℃~+600ppm/℃; Operating Temperature Range: -55℃~+155℃
R56 R60 = ERJ2GE0R00X: 电阻类型:-;阻值:0Ω;功率:100mW;温度系数:-100ppm/℃~+600ppm/℃;最大工作电压:-;工作温度范围:-55℃~+155℃;; LCSC Part Name: 0Ω 100mW; Manufacturer: PANASONIC(松下); Supplier Footprint: 0402; JLCPCB Part Class: 扩展库; Datasheet: https://atta.szlcsc.com/upload/public/pdf/source/20181106/C242160_CA6E41971DE5A1DCD79442F3CF334CD6.pdf; Supplier: LCSC; Power(Watts): 100mW; Temperature Coefficient: -100ppm/℃~+600ppm/℃; Operating Temperature Range: -55℃~+155℃
R57 = 0402WGF220JTCE: 电阻类型:厚膜电阻;阻值:22Ω;精度:±1%;功率:62.5mW;温度系数:±100ppm/℃;; LCSC Part Name: 厚膜电阻 22Ω ±1% 62.5mW; Supplier Part: C25092; Manufacturer: UNI-ROYAL(厚声); Supplier Footprint: 0402; JLCPCB Part Class: Basic Part; Datasheet: https://atta.szlcsc.com/upload/public/pdf/source/20200306/C422600_1E6D84923E4A46A82E41ADD87F860B5C.pdf; Supplier: LCSC; Type: 厚膜电阻; Tolerance: ±1%; Power(Watts): 62.5mW; Temperature Coefficient: ±100ppm/℃; Overload Voltage (Max): 50V; Operating Temperature Range: -55℃~+155℃
R49 R52 R58 = CRCW040210K0FKED: 电阻类型:厚膜电阻;阻值:10kΩ;精度:±1%;功率:63mW;温度系数:±100ppm/K;最大工作电压:50V;工作温度范围:-55℃~+155℃;; LCSC Part Name: 10kΩ ±1% 63mW; Supplier Part: C71617; Manufacturer: VISHAY(威世); Supplier Footprint: 0402; JLCPCB Part Class: 扩展库; Datasheet: https://atta.szlcsc.com/upload/public/pdf/source/20180224/C71617_15194370300791364062.pdf; Supplier: LCSC; Type: 厚膜电阻; Tolerance: ±1%; Power(Watts): 63mW; Temperature Coefficient: ±100ppm/K; Overload Voltage (Max): 50V; Operating Temperature Range: -55℃~+155℃
R61 = 0402WGF4701TCE: 电阻类型:厚膜电阻;阻值:4.7kΩ;精度:±1%;功率:62.5mW;; LCSC Part Name: 4.7kΩ ±1% 62.5mW; Manufacturer: UNI-ROYAL(厚声); Supplier Footprint: 0402; JLCPCB Part Class: 基础库; Datasheet: https://atta.szlcsc.com/upload/public/pdf/source/20200306/C422600_1E6D84923E4A46A82E41ADD87F860B5C.pdf; Supplier: LCSC; Type: 厚膜电阻; Tolerance: ±1%; Power(Watts): 62.5mW; Temperature Coefficient: ±100ppm/℃; Overload Voltage (Max): 50V; Operating Temperature Range: -55℃~+155℃
R122 = RC0402FR-0730KL: 电阻类型:厚膜电阻;阻值:30kΩ;精度:±1%;功率:62.5mW;; LCSC Part Name: 30kΩ ±1% 62.5mW; Supplier Part: C138008; Manufacturer: YAGEO(国巨); Supplier Footprint: 0402; JLCPCB Part Class: Extended Part; Datasheet: https://atta.szlcsc.com/upload/public/pdf/source/20171107/C138008_15100516356731096935.pdf; Supplier: LCSC; Type: 厚膜电阻; Tolerance: ±1%; Power(Watts): 62.5mW; Temperature Coefficient: ±100ppm/℃; Overload Voltage (Max): 50V; Operating Temperature Range: -55℃~+155℃
R184 R186 = RC-02W104JT: 电阻类型:厚膜电阻;阻值:100kΩ;精度:±5%;功率:62.5mW;最大工作电压:50V;温度系数:±200ppm/℃;; LCSC Part Name: 厚膜电阻 100kΩ ±5% 62.5mW; Supplier Part: C280907; Manufacturer: FH(风华); Supplier Footprint: 0402; JLCPCB Part Class: Extended Part; Datasheet: https://atta.szlcsc.com/upload/public/pdf/source/20140616/1457707091974.pdf; Supplier: LCSC; Type: 厚膜电阻; Tolerance: ±5%; Power(Watts): 62.5mW; Overload Voltage (Max): 50V; Temperature Coefficient: ±200ppm/℃; Operating Temperature Range: -55℃~+155℃
U3 = TCS4525_WT: 高频，高电流同步降压DC-DC模块
U26 = SY8089AAAC: 功能类型:降压型;同步整流:-;输出通道数:-;拓扑结构:-;输入电压:-;输出电流(最大值):-;开关频率:-;; LCSC Part Name: 降压型; Supplier Part: C78988; Manufacturer: silergy(矽力杰); Supplier Footprint: SOT-23-5; JLCPCB Part Class: Extended Part; Datasheet: https://atta.szlcsc.com/upload/public/pdf/source/20210826/394049C81A2AF57A190C26FDBC282657.pdf; Supplier: LCSC; Function: 降压型; Output Type: 可调; Voltage - Supply: 2.7V~5.5V; Output Current: 2A; Frequency - Switching: 1MHz; Operating Temperature: -40℃~+85℃@(TA); Synchronous Rectifier: 是; Quiescent Current: 55uA; Switch tube (built-in/external): 内置
U131 U132 = SY8113BADC: 功能类型:降压型;输出类型:可调;工作电压:4.5V~18V;输出电压:-;输出电流:3A;; LCSC Part Name: 高效率500kHz 3A 18V输入同步降压转换器; Supplier Part: C78989; Manufacturer: Silergy(矽力杰); Supplier Footprint: TSOT-23-6; JLCPCB Part Class: Extended Part; Datasheet: https://item.szlcsc.com/datasheet/SY8113BADC/80126.html; Supplier: LCSC; Function: 降压型; Output Type: 可调; Voltage - Supply: 4.5V~18V; Output Current: 3A; Frequency - Switching: 500kHz; Operating Temperature: -40℃~+125℃@(TJ); Synchronous Rectifier: 是; Number of Outputs: 1; Topology: 降压式; Quiescent Current: 100uA; Switch tube (built-in/external): 内置
C106 = CL05A106MQ5NUNC: 容值:10uF;精度:±20%;额定电压:6.3V;材质(温度系数):X5R;; LCSC Part Name: 10uF ±20% 6.3V; Supplier Part: C15525; Manufacturer: SAMSUNG(三星); Supplier Footprint: 0402; JLCPCB Part Class: 基础库; Datasheet: https://atta.szlcsc.com/upload/public/pdf/source/20220823/2B02EE04F8F211D38A52DCB16EB6BEBA.pdf; Supplier: LCSC; Tolerance: ±20%; Voltage Rated: 6.3V; Temperature Coefficient: X5R
C139 = CL05A106MQ5NUNC: 容值:10uF;精度:±20%;额定电压:6.3V;材质(温度系数):X5R;; LCSC Part Name: 10uF ±20% 6.3V; Supplier Part: C15525; Manufacturer: SAMSUNG(三星); Supplier Footprint: 0402; JLCPCB Part Class: Basic Part; Datasheet: https://atta.szlcsc.com/upload/public/pdf/source/20220823/2B02EE04F8F211D38A52DCB16EB6BEBA.pdf; Supplier: LCSC; Tolerance: ±20%; Voltage Rated: 6.3V; Temperature Coefficient: X5R
C140 C143 = 0402CG120J500NT: 容值:12pF;精度:±5%;额定电压:50V;材质(温度系数):C0G;; LCSC Part Name: 12pF ±5% 50V; Supplier Part: C1547; Manufacturer: FH(风华); Supplier Footprint: 0402; JLCPCB Part Class: Basic Part; Datasheet: https://atta.szlcsc.com/upload/public/pdf/source/20200305/C486355_26A10D38EF8C2A5C37091D0039909270.pdf; Supplier: LCSC; Tolerance: ±5%; Voltage Rated: 50V; Temperature Coefficient: C0G
C141 = CL05A475MQ5NRNC: 容值:4.7uF;精度:±20%;额定电压:6.3V;材质(温度系数):X5R;; LCSC Part Name: 4.7uF ±20% 6.3V; Supplier Part: C307423; Manufacturer: SAMSUNG(三星); Supplier Footprint: 0402; JLCPCB Part Class: Extended Part; Datasheet: https://atta.szlcsc.com/upload/public/pdf/source/20181010/C307423_0E0C4E35F3A09F81C2E5C84E00499E42.pdf; Supplier: LCSC; Tolerance: ±20%; Voltage Rated: 6.3V; Temperature Coefficient: X5R
C142 = 0402CG101J500NT: 容值:100pF;精度:±5%;额定电压:50V;材质(温度系数):C0G;; LCSC Part Name: 100pF ±5% 50V; Supplier Part: C1546; Manufacturer: FH(风华); Supplier Footprint: 0402; JLCPCB Part Class: Basic Part; Datasheet: https://atta.szlcsc.com/upload/public/pdf/source/20170923/C1546_1506149265265988353.pdf; Supplier: LCSC; Tolerance: ±5%; Voltage Rated: 50V; Temperature Coefficient: C0G
C148 C149 = 0402B681K500NT: 容值:680pF;精度:±10%;额定电压:50V;材质(温度系数):X7R;; LCSC Part Name: 680pF ±10% 50V; Supplier Part: C1541; Manufacturer: FH(风华); Supplier Footprint: 0402; JLCPCB Part Class: Extended Part; Datasheet: https://atta.szlcsc.com/upload/public/pdf/source/20170923/C1541_1506149263051988348.pdf; Supplier: LCSC; Tolerance: ±10%; Voltage Rated: 50V; Temperature Coefficient: X7R
C150 = CL05B104KO5NNNC: 容值:100nF;精度:±10%;额定电压:16V;材质(温度系数):X7R;; LCSC Part Name: 100nF ±10% 16V; Supplier Part: C1525; Manufacturer: SAMSUNG(三星); Supplier Footprint: 0402; JLCPCB Part Class: 基础库; Datasheet: https://atta.szlcsc.com/upload/public/pdf/source/20160103/1457707674891.pdf; Supplier: LCSC; Tolerance: ±10%; Voltage Rated: 16V; Temperature Coefficient: X7R
C152 = 0402CG270J500NT: 容值:27pF;精度:±5%;额定电压:50V;材质(温度系数):C0G;; LCSC Part Name: 27pF ±5% 50V; Supplier Part: C1557; Manufacturer: FH(风华); Supplier Footprint: 0402; JLCPCB Part Class: Basic Part; Datasheet: https://atta.szlcsc.com/upload/public/pdf/source/20170923/C1557_1506149270123988364.pdf; Supplier: LCSC; Tolerance: ±5%; Voltage Rated: 50V; Temperature Coefficient: C0G
L8 = BLM15AG121SN1D: 标称阻抗@测试频率:120Ω@100MHz;误差:±25%;直流电阻(RDC):250mΩ;额定电流:500mA;电路数:1;; LCSC Part Name: 120Ω@100MHz ±25%; Supplier Part: C85812; Manufacturer: muRata(村田); Supplier Footprint: 0402; JLCPCB Part Class: Extended Part; Datasheet: https://atta.szlcsc.com/upload/public/pdf/source/20180326/C85812_709B7ABD18A92BCC8FFBD7A231EEE264.pdf; Supplier: LCSC; Impedance @ Frequency: 120Ω@100MHz; Tolerance: ±25%; DC Resistance: 250mΩ; Current Rating: 500mA; Circuits: 1
L9 L10 = BLM18PG181SN1D: 标称阻抗@测试频率:180Ω@100MHz;误差:±25%;直流电阻(RDC):90mΩ;额定电流:1.5A;电路数:1;; LCSC Part Name: 180Ω@100MHz ±25%; Supplier Part: C82850; Manufacturer: muRata(村田); Supplier Footprint: 0603; JLCPCB Part Class: Extended Part; Datasheet: https://atta.szlcsc.com/upload/public/pdf/source/20180326/C82850_BC876320DC99E3923AFD377E2F9C4AED.pdf; Supplier: LCSC; Impedance @ Frequency: 180Ω@100MHz; Tolerance: ±25%; DC Resistance: 90mΩ; Current Rating: 1.5A; Circuits: 1
R44 = 0402WGF4702TCE: 电阻类型:厚膜电阻;阻值:47kΩ;精度:±1%;功率:62.5mW;温度系数:±100ppm/℃;最大工作电压:50V;工作温度范围:-55℃~+155℃;; LCSC Part Name: 47kΩ ±1% 62.5mW; Supplier Part: C25792; Manufacturer: UNI-ROYAL(厚声); Supplier Footprint: 0402; JLCPCB Part Class: Basic Part; Datasheet: https://atta.szlcsc.com/upload/public/pdf/source/20200306/C422600_1E6D84923E4A46A82E41ADD87F860B5C.pdf; Supplier: LCSC; Type: 厚膜电阻; Tolerance: ±1%; Power(Watts): 62.5mW; Temperature Coefficient: ±100ppm/℃; Overload Voltage (Max): 50V; Operating Temperature Range: -55℃~+155℃
R45 = 0402WGF1203TCE: 电阻类型:厚膜电阻;阻值:120kΩ;精度:±1%;功率:62.5mW;温度系数:±100ppm/℃;最大工作电压:50V;工作温度范围:-55℃~+155℃;; LCSC Part Name: 120kΩ ±1% 62.5mW; Supplier Part: C25750; Manufacturer: UNI-ROYAL(厚声); Supplier Footprint: 0402; JLCPCB Part Class: Basic Part; Datasheet: https://atta.szlcsc.com/upload/public/pdf/source/20200306/C422600_1E6D84923E4A46A82E41ADD87F860B5C.pdf; Supplier: LCSC; Type: 厚膜电阻; Tolerance: ±1%; Power(Watts): 62.5mW; Temperature Coefficient: ±100ppm/℃; Overload Voltage (Max): 50V; Operating Temperature Range: -55℃~+155℃
R48 = RC0402FR-07180KL: 电阻类型:厚膜电阻;阻值:180kΩ;精度:±1%;功率:62.5mW;温度系数:±100ppm/℃;最大工作电压:50V;工作温度范围:-55℃~+155℃;; LCSC Part Name: 180kΩ ±1% 62.5mW; Supplier Part: C138046; Manufacturer: YAGEO(国巨); Supplier Footprint: 0402; JLCPCB Part Class: Extended Part; Datasheet: https://atta.szlcsc.com/upload/public/pdf/source/20171107/C138046_15100516638711096969.pdf; Supplier: LCSC; Type: 厚膜电阻; Tolerance: ±1%; Power(Watts): 62.5mW; Temperature Coefficient: ±100ppm/℃; Overload Voltage (Max): 50V; Operating Temperature Range: -55℃~+155℃
R51 = 0402WGF5602TCE: 精度:±1%;功率:1/16W;温度系数:±100ppm/℃;阻值:56kΩ;最大工作电压:50V;工作温度范围:-55℃~+155℃;; LCSC Part Name: 56KΩ ±1%; Supplier Part: C25796; Manufacturer: UNI-ROYAL(厚声); Supplier Footprint: 0402; JLCPCB Part Class: Basic Part; Datasheet: https://atta.szlcsc.com/upload/public/pdf/source/20170920/C25796_1505901547482983369.pdf; Supplier: LCSC; Tolerance: ±1%; Power(Watts): 1/16W; Temperature Coefficient: ±100ppm/℃; Overload Voltage (Max): 50V; Operating Temperature Range: -55℃~+155℃
U21 = RK809-5
U121-U125 = FTC252012SR47MBCA: 电感值:470nH;精度:±20%;额定电流:6.5A;饱和电流(Isat):7.5A;类型:-;; LCSC Part Name: 470nH ±20% 7.5A; Supplier Part: C5832368; Manufacturer: cjiang(长江微电); Supplier Footprint: 1008; JLCPCB Part Class: 扩展库; Datasheet: https://item.szlcsc.com/datasheet/FTC252012SR47MBCA/6763488.html; Supplier: LCSC; Tolerance: ±20%; Current Rating: 6.5A; Current - Saturation(Isat): 7.5A; DC Resistance(DCR): 13mΩ
X2 = XKXGI-SUA-32.768K: 频率:32.768kHz;频率公差:±20ppm;负载电容:12.5pF;; LCSC Part Name: 32.768kHz ±20ppm 12.5pF YST310S; Supplier Part: C5213671; Manufacturer: YXC(扬兴晶振); Supplier Footprint: SMD3215-2P; JLCPCB Part Class: Extended Part; Datasheet: https://atta.szlcsc.com/upload/public/pdf/source/20221026/C961783E7D3E186CA8CEB40DFC46D85F.pdf; Supplier: LCSC; Crystal Type: 贴片无源晶振; Frequency Tolerance: ±20ppm; Load Capacitance: 12.5pF; Operating Temperature: -40℃~+85℃; Equivalent Series Resistance (ESR): 70kΩ
C259 C260 = CC0402JRNPO9BN100: 容值:10pF;精度:±5%;额定电压:50V;温度系数:NP0;; LCSC Part Name: 10pF ±5% 50V; Manufacturer: YAGEO(国巨); Supplier Footprint: 0402; JLCPCB Part Class: 扩展库; Datasheet: https://item.szlcsc.com/datasheet/CC0402JRNPO9BN100/107414.html; Supplier: LCSC; Tolerance: ±5%; Voltage Rating: 50V; Temperature Coefficient: NP0; Voltage Rated: 50V
C261 = CC0402FRNPO9BN100: 容值:10pF;精度:±1%;额定电压:50V;材质(温度系数):NP0;; LCSC Part Name: 10pF ±1% 50V; Supplier Part: C513681; Manufacturer: YAGEO(国巨); Supplier Footprint: 0402; JLCPCB Part Class: Extended Part; Datasheet: https://atta.szlcsc.com/upload/public/pdf/source/20200415/C513681_5027FF1861A780E76D33CC24CC34CA99.pdf; Supplier: LCSC; Tolerance: ±1%; Voltage Rated: 50V; Temperature Coefficient: NP0
C263 = CL10A105KO8NNNC: 容值:1uF;精度:±10%;额定电压:16V;材质(温度系数):X5R;; LCSC Part Name: 1uF ±10% 16V; Supplier Part: C1592; Manufacturer: SAMSUNG(三星); Supplier Footprint: 0603; JLCPCB Part Class: Extended Part; Datasheet: https://atta.szlcsc.com/upload/public/pdf/source/20220919/9FBE606BE0D9532D730F292EB26DC5BB.pdf; Supplier: LCSC; Tolerance: ±10%; Voltage Rated: 16V; Temperature Coefficient: X5R
C264 C265 = CC0603JRNPO9BN120: 容值:12pF;精度:±5%;额定电压:50V;材质(温度系数):NP0;; LCSC Part Name: 12pF ±5% 50V; Supplier Part: C107034; Manufacturer: YAGEO(国巨); Supplier Footprint: 0603; JLCPCB Part Class: Extended Part; Datasheet: https://atta.szlcsc.com/upload/public/pdf/source/20170420/1492670686468.pdf; Supplier: LCSC; Tolerance: ±5%; Voltage Rated: 50V; Temperature Coefficient: NP0
C266 = CL05A105KA5NQNC: 容值:1uF;精度:±10%;额定电压:25V;温度系数:X5R;; LCSC Part Name: 1uF ±10% 25V; Supplier Part: C52923; Manufacturer: SAMSUNG(三星); Supplier Footprint: 0402; JLCPCB Part Class: Basic Part; Datasheet: https://item.szlcsc.com/datasheet/CL05A105KA5NQNC/53938.html; Supplier: LCSC; Tolerance: ±10%; Voltage Rating: 25V; Temperature Coefficient: X5R; Voltage Rated: 25V
C268 = CL05A475KP5NRNC: 容值:4.7uF;精度:±10%;额定电压:10V;材质(温度系数):X5R;; LCSC Part Name: 4.7uF ±10% 10V; Supplier Part: C368809; Manufacturer: SAMSUNG(三星); Supplier Footprint: 0402; Datasheet: https://atta.szlcsc.com/upload/public/pdf/source/20190214/C368809_F5BC89A17870A6A4D09EEE17ED063906.pdf; Supplier: LCSC; Tolerance: ±10%; Voltage Rated: 10V; Temperature Coefficient: X5R
L17 = MLP2520S4R7MT0S1: 电感值:4.7uH;精度:±20%;额定电流:1A;饱和电流(Isat):-;直流电阻(DCR):130mΩ;; LCSC Part Name: 4.7uH ±20% 1A 130mΩ; Supplier Part: C91237; Manufacturer: TDK; Supplier Footprint: 1008; Datasheet: https://atta.szlcsc.com/upload/public/pdf/source/20171113/C91237_15105616670831116159.pdf; Supplier: LCSC; Tolerance: ±20%; Rated Current: 1A; DC Resistance (DCR): 130mΩ
R106 = 0402WGF1002TCE: 电阻类型:厚膜电阻;阻值:10kΩ;精度:±1%;功率:62.5mW;; LCSC Part Name: 10kΩ ±1% 62.5mW; Supplier Part: C25744; Manufacturer: UNI-ROYAL(厚声); Supplier Footprint: 0402; JLCPCB Part Class: 基础库; Datasheet: https://atta.szlcsc.com/upload/public/pdf/source/20200306/C422600_1E6D84923E4A46A82E41ADD87F860B5C.pdf; Supplier: LCSC; Type: 厚膜电阻; Tolerance: ±1%; Power(Watts): 62.5mW; Temperature Coefficient: ±100ppm/℃; Overload Voltage (Max): 50V; Operating Temperature Range: -55℃~+155℃
R107 = 0402WGF0000TCE: 电阻类型:厚膜电阻;阻值:0Ω;精度:±1%;功率:62.5mW;; LCSC Part Name: 0Ω ±1% 62.5mW; Supplier Part: C17168; Manufacturer: UNI-ROYAL(厚声); Supplier Footprint: 0402; JLCPCB Part Class: 基础库; Datasheet: https://atta.szlcsc.com/upload/public/pdf/source/20200306/C422600_1E6D84923E4A46A82E41ADD87F860B5C.pdf; Supplier: LCSC; Type: 厚膜电阻; Tolerance: ±1%; Power(Watts): 62.5mW; Temperature Coefficient: ±800ppm/℃; Overload Voltage (Max): 50V; Operating Temperature Range: -55℃~+155℃
RF1 = BWIPX-1-001E: 连接器类型:板端;射频系列:IPEX;接口类型:内针;端口数量:1;阻抗:-;频率-最大值:-;样式:-;接口直径:-;接口长度/高度:-;工作温度范围:-;; LCSC Part Name: IPEX 内针一代板端  IPEX1座子 IPEX1 一代板端座子; Supplier Part: C496552; Manufacturer: BAT WIRELESS(蝙蝠无线); Supplier Footprint: SMD; JLCPCB Part Class: Extended Part; Datasheet: https://atta.szlcsc.com/upload/public/pdf/source/20201223/C496552_05E5A9956EAE1A8819C5051D085B1DED.pdf; Supplier: LCSC; Connector Type: 板端; RF Series: IPEX; Interface Type: 内针; Number of Ports: 1
U15 = AP6256: 核心芯片:BCM43456;频率:5GHz;发射功率:17dBm;接收灵敏度:-96dBm;; LCSC Part Name: WIFI模块; Supplier Part: C5248079; Manufacturer: AMPAK(正基科技); Supplier Footprint: QFN-44(12x12); JLCPCB Part Class: Extended Part; Datasheet: https://item.szlcsc.com/datasheet/AP6256/5960630.html; Supplier: LCSC; Utilized IC / Part: BCM43456; Wireless Standard: IEEE802.11b/g/n；Bluetooth5.2; Interface Type: GPIO；PCM；SDIO；UART; Output Power: 17dBm; Voltage - Supply: 3.2V~4.8V; Sensitivity: -96dBm; Operating Temperature: -30℃~+85℃; Features: 集成蓝牙功能
X1 = XL7EL89COI-111YLC-37.4M: 晶振类型:贴片晶振;频率:37.4MHz;常温频差:±10ppm;负载电容:12pF;频率稳定度:±20ppm;; LCSC Part Name: YSX211SL 37.4MHZ 12PF ±10PPM -40~85℃; Supplier Part: C52160879; Manufacturer: YXC(扬兴晶振); Supplier Footprint: SMD2016-4P; JLCPCB Part Class: Extended Part; Datasheet: https://item.szlcsc.com/datasheet/XL7EL89COI-111YLC-37.4M/54975080.html; Supplier: LCSC; Type: 贴片晶振; Normal temperature Frequency Tolerance: ±10ppm; Load Capacitance: 12pF; Frequency Stability: ±20ppm; Equivalent Series Resistance(ESR): 80Ω; Operating Temperature: -40℃~+85℃

## Nets
GND: C91.1 C92.1 C94.1 C95.1 C96.1 C97.1 C99.1 C100.1 C102.1 C103.1 C104.1 C105.1 C106.2 C107.1 C108.2 C109.2 C110.2 C112.2 C113.1 C114.2 C115.1 C117.1 C118.2 C119.2 C120.2 C121.1 C122.2 C123.1 C124.2 C125.2 C127.2 C128.1 C129.1 C130.2 C131.2 C132.1 C133.2 C134.1 C135.2 C136.1 C137.1 C138.2 C139.1 C140.1 C142.2 C143.2 C144.1 C145.1 C146.1 C147.1 C148.1 C149.1 C151.1 C152.1 C153.1 C154.2 C155.1 C156.1 C158.1 C159.1 C160.1 C161.1 C162.1 C163.1 C259.2 C260.2 C262.1 C263.1 C264.1 C265.1 C266.1 C267.1 C268.1 C269.1 C337.2 C338.1 C339.1 C340.1 C341.1 LED2.1(K) R35.1 R40.1 R45.1 R51.1 R61.1 R106.1 R107.2 R108.2 R122.1 R186.2 R655.2 RF1.2(GND) RF1.3(GND) U3.B2(GND) U3.B3(GND) U3.B4(AGND) U3.C1(GND) U3.C2(GND) U3.C3(GND) U3.C4(GND) U15.1(GND) U15.3(GND) U15.20(GND) U15.31(GND) U15.33(GND) U15.36(GND) U21.47(GNDREF) U21.56(BATDIV) U21.62(SNSP) U21.63(SNSN) U21.69(EPAD) U26.2(GND) U131.2(GND) U132.2(GND) X1.2(GND) X1.4(GND) ; also on sheet 1 2 3 4 5 6 7 8 9 10 11 12 13 14 15 16 17 18 19 20 24 25
VCC0V6_DDR: C338.2 C339.2 C340.2 C342.1 L21.2 R614.1 ; also on sheet 24
VCC3V3_PMU: C120.1 R52.1 R53.2 R58.1 U21.31(LDO6) ; also on sheet 14
VCC3V3_SD: C130.1 U21.58(SWOUT2) ; also on sheet 18
VCC3V3_SYS: C101.2 C102.2 C104.2 C105.2 C106.1 C107.2 C117.2 C121.2 C123.2 C129.2 C134.2 C138.1 C262.2 C263.2 C337.1 L2.2 R37.2 R39.2 U15.9(VBAT) U21.4(VCC7) U21.10(VCC2) U21.11(VCC1) U21.22(VCC5) U21.24(VCC3) U21.30(VCC6) U21.45(VCC_RTC) U21.54(VCC9) U21.57(VCC8) U21.66(VCC4) U26.4(IN) ; also on sheet 9 10 20
VCC5V0_SYS: C93.2 C94.2 C95.2 C99.2 C100.2 C155.2 C156.2 L8.1 L16.2 R33.2 R36.2 R48.2 U3.D1(VIN) U3.D2(VIN) U3.E1(VIN) U3.E2(VIN) U132.5(IN) ; also on sheet 6 7 10 19 20
VCC_1V8: C135.1 C136.2 R46.1 R55.1 R59.1 U125.2 ; also on sheet 11
VCC_3V3: C133.1 R56.1 R60.1 U21.55(SWOUT1) ; also on sheet 7 8 13 15 16 17 25
VCC_DCIN: C91.2 C92.2 F1.2 R32.2 U131.5(IN)
VCC_SYS_OUT: F1.1 R31.1 ; also on sheet 9 12
VCCA1V8_IMAGE: C125.1 U21.6(LDO9) ; also on sheet 4 11
VCCA1V8_PMU: C124.1 U21.5(LDO8) ; also on sheet 14 24
VCCA_1V8: C122.1 U21.3(LDO7) ; also on sheet 8 13 14 19
VCCIO_ACODEC: C118.1 U21.28(LDO4) ; also on sheet 5 20
VCCIO_FLASH: C163.2 R59.2 R60.2 ; also on sheet 3 25
VCCIO_SD: C119.1 U21.29(LDO5) ; also on sheet 3
VCCIO_WL: C162.2 C266.2 C267.2 R49.1 R55.2 R56.2 U15.22(VDDIO) ; also on sheet 13
VDD1_1V8_DDR: R184.2 ; also on sheet 24
VDD2_DDR: C131.1 C132.2 R44.1 U21.26(VBUCK3) U123.2 ; also on sheet 2 24
VDD_CPU: C157.1 C157.2 C158.2 C159.2 C160.2 L12.2 R54.1 R54.2 U3.A4(VOUT) ; also on sheet 1
VDD_GPU: C126.1 C126.2 C127.1 C128.2 R43.1 R43.2 U21.8(FB2) U121.1 ; also on sheet 1
VDD_LOGIC: C111.1 C111.2 C112.1 C113.2 R41.1 R41.2 U21.13(FB1) U122.1 ; also on sheet 1
VDD_NPU: C114.1 C115.2 C116.1 C116.2 R42.1 R42.2 U21.64(FB4) U124.2 ; also on sheet 1
VDDA0V9_IMAGE: C108.1 U21.23(LDO1) ; also on sheet 4 11
VDDA0V9_PMU: C110.1 U21.20(LDO3) ; also on sheet 14
VDDA_0V9: C109.1 U21.21(LDO2) ; also on sheet 8 14
VIN_LDO: C268.2 C269.2 L17.1 U15.23(VIN_LDO)
VIN_LDO_OUT: L17.2 U15.21(VIN_LDO_OUT)
BT_REG_ON_H: U15.34(BT_RST_N) ; also on sheet 13
BT_WAKE_HOST_H: U15.7(BT_HOST_WAKE) ; also on sheet 13
FLASH_VOL_SEL: R58.2 R61.2 ; also on sheet 14
HOST_WAKE_BT_H: U15.6(BT_WAKE) ; also on sheet 13
HP_SNS: C142.1 U21.40(HP_SNS)
HPL_OUT: U21.39(HPL_OUT)
HPR_OUT: U21.41(HPR_OUT)
I2C0_SCL_PMIC: U3.A3(SCL) U21.1(SCL) ; also on sheet 14
I2C0_SDA_PMIC: U3.B1(SDA) U21.2(SDA) ; also on sheet 14
I2S1_LRCK_TX_M0_PMIC: U21.14(LRCLK) ; also on sheet 5
I2S1_MCLK_M0_PMIC: U21.16(MCLK) ; also on sheet 5
I2S1_SCLK_TX_M0_PMIC: U21.15(BCLK) ; also on sheet 5
I2S1_SDI0_M0/PDM: U21.18(SDO/PDMDATA) ; also on sheet 5
I2S1_SDO0_M0_PMIC: U21.17(SDI) ; also on sheet 5
I2S2_LRCK_TX_M0: U15.28(PCM_SYNC) ; also on sheet 13
I2S2_SCLK_TX_M0: U15.26(PCM_CLK) ; also on sheet 13
I2S2_SDI_M0: R108.1 U15.25(PCM_OUT) ; also on sheet 13
I2S2_SDO_M0: U15.27(PCM_IN) ; also on sheet 13
MICP: C150.2 ; also on sheet 20
PDM_CLK0_M0_PMIC: U21.19(PDMCLK) ; also on sheet 5
PMIC_32KOUT_WIFI: R49.2 R50.1 U15.24(LPO)
PMIC_INT_L: U21.7(INT) ; also on sheet 14
PMIC_SLEEP_H: R57.1 U21.49(SLEEP) ; also on sheet 14
PWRON_KEY: C154.1 U21.52(PWRON) ; also on sheet 19
RESETN: C153.2 R52.2 U21.67(RESETB) ; also on sheet 14 19
SDMMC1_CLK: U15.17(SDIO_DATA_CLK) ; also on sheet 13
SDMMC1_CMD: U15.16(SDIO_DATA_CMD) ; also on sheet 13
SDMMC1_D0: U15.18(SDIO_DATA_0) ; also on sheet 13
SDMMC1_D1: U15.19(SDIO_DATA_1) ; also on sheet 13
SDMMC1_D2: U15.14(SDIO_DATA_2) ; also on sheet 13
SDMMC1_D3: U15.15(SDIO_DATA_3) ; also on sheet 13
SPK_OUTN: C149.2 L9.2 ; also on sheet 20
SPK_OUTP: C148.2 L10.2 ; also on sheet 20
UART1_CTSN_M0: R106.2 U15.41(UART_RTS_N) ; also on sheet 13
UART1_RTSN_M0: U15.44(UART_CTS_N) ; also on sheet 13
UART1_RX_M0: U15.42(UART_TXD) ; also on sheet 13
UART1_TX_M0: U15.43(UART_RXD) ; also on sheet 13
VSEL_EXTDCDC: R57.2 U3.A1(VSEL)
WIFI_REG_ON_H: U15.12(WL_REG_ON) ; also on sheet 13
WIFI_WAKE_HOST_H: U15.13(WL_HOST_WAKE) ; also on sheet 13
WIFI_XTAL_IN: C265.2 U15.10(XTAL_IN) X1.3
WIFI_XTAL_OUT: C264.2 U15.11(XTAL_OUT) X1.1
$13N4478: U21.12(SW1) U122.2
$13N4485: U21.9(SW2) U121.2
$13N4488: U21.65(SW4) U124.1
$13N4494: U21.25(SW3) U123.1
$13N4496: R44.2 R45.2 U21.27(FB3)
$13N4510: U21.53(SW5) U125.1
$13N4512: C137.2 U21.46(VREF)
$13N4516: C140.2 U21.50(XIN) X2.2
$13N4527: R50.2 U21.68(CLK32K)
$13N4536: C151.2 R48.1 R51.2 U21.61(VDC)
$13N4539: C144.2 U21.38(VCC_CPVDD)
$13N4546: C143.1 U21.51(XOUT) X2.1
$13N4551: C147.2 U21.44(VCC_1P8A)
$13N4552: C146.2 U21.48(VCC_1P8D)
$13N4553: C145.2 U21.35(VCC_CPVSS)
$13N4566: L9.1 U21.34(SPK_OUTn)
$13N4567: L10.1 U21.32(SPK_OUTp)
$13N4573: C150.1 C152.2 U21.43(MIC1p)
$13N4578: C141.1 U21.36(CPn)
$13N4579: C141.2 U21.37(CPp)
$13N4587: C139.2 L8.2 U21.33(VCC_SPK_HP)
$13N4604: R46.2 R655.1 U21.59(FB5)
$14N4693: C259.1 C261.1 RF1.1(SIG)
$14N4694: C260.1 C261.2 U15.2(WL_BT_ANT)
$14N4707: R107.1 U15.29(NC)
$20N872: C161.2 R53.1 U3.A2(EN)
$20N882: L12.1 U3.D3(SW_1) U3.D4(SW_2) U3.E3(SW_3) U3.E4(SW_4)
$20N2096: C341.2 R184.1 U26.1(EN)
$20N2099: L21.1 U26.3(LX)
$20N2107: C342.2 R186.1 R614.2 U26.5(FB)
$20N4384: C96.2 R32.1 U131.4(EN)
$20N4389: C90.2 U131.1(BS)
$20N4390: C90.1 L16.1 U131.6(LX)
$20N4391: C93.1 R33.1 R35.2 U131.3(FB)
$20N4400: C98.2 U132.1(BS)
$20N4401: C98.1 L2.1 U132.6(LX)
$20N4402: C101.1 R37.1 R40.2 U132.3(FB)
$20N4414: C97.2 R31.2
$20N4418: C103.2 R36.1 R122.2 U132.4(EN)
$20N20363: LED2.2(A) R39.1

Not connected (* = marked no-connect by the designer): U15 4(FM_RX)* 5(NC)* 8(CLK_REQ)* 30(NC)* 32(NC)* 35(NC)* 37(GPIO4)* 38(GPIO3)* 39(GPIO2)* 40(GPIO1)* 45(TP1)* 46(TP2)* 47(TP3(NC))*; U21 42(MIC1n)* 60(EXT_EN)*

## Notes on the sheets
sheet 21
- VCCIO_WL
- 后续请勿更新库，相关管脚会修改。
- VCC 5-18V宽电压_DCIN 转 VCC_5V
- 后续请勿更新库，相关管脚会修改。
- VCC_LPDDR4X
- VCC5V_SYS 转 VCC3V3_SYS
- Flash Power Manage
- Option1
- Option1
- Option2
- Feedback from RK3566
- Option2
- FLASH_VOL_SEL state decided
  to VCCIO2 domain IO driven by default
  Logic=L：3.3V IO driven
  Logic=H：1.8V IO driven
- VDD_CPU_EXT
sheet 22
- Default:1.1V
- PMIC RK809 DCDC
- PMIC RK809 LDO
- PMIC RK809 Managerment
- PMIC RK809 CODEC
- 1.2V
- If RK809-5 codec is not used,
  then Pin 14,15,16,17,19,40 Tie VSS
  Pin 18,36,37,38,35,39,41,34,32,43,42
  Leave floating
sheet 23
- SDIO WIFI/BT
- Option1
- Option4
- Option3
- NC
- Option2
- Option5
